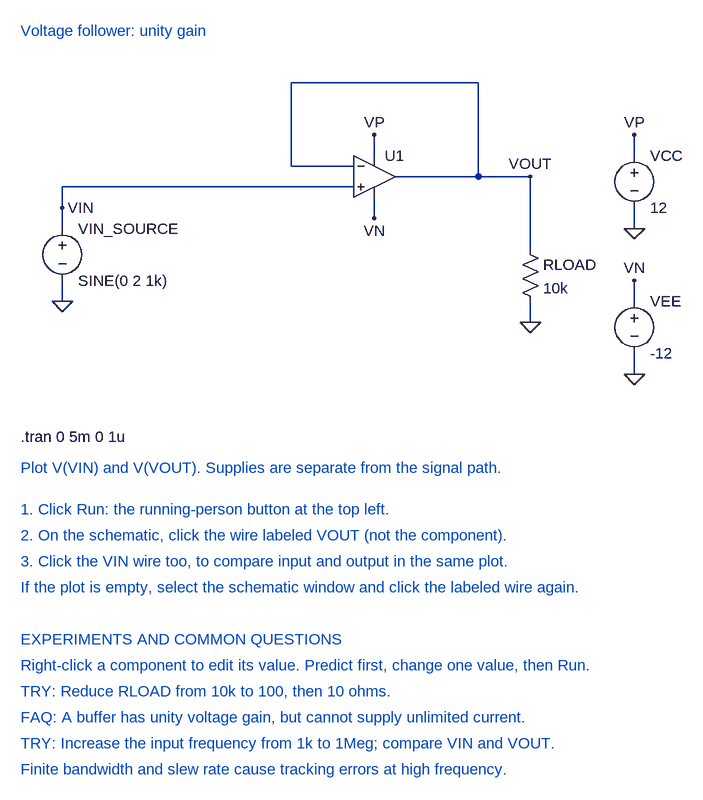
[diagram p0: schematic 06-voltage-follower.asc]
06-voltage-follower.asc, the LTspice schematic file:
Version 4
SHEET 1 1200 1400
WIRE 608 224 608 192
WIRE 608 288 608 320
WIRE 128 304 128 336
WIRE 128 416 128 448
WIRE 128 304 128 272
WIRE 128 272 576 272
WIRE 640 256 848 256
WIRE 848 256 848 368
WIRE 848 448 848 480
WIRE 480 240 576 240
WIRE 480 240 480 112
WIRE 480 112 768 112
WIRE 768 112 768 256
WIRE 1008 192 1008 224
WIRE 1008 304 1008 336
WIRE 1008 416 1008 448
WIRE 1008 528 1008 560
FLAG 608 192 VP
FLAG 608 320 VN
FLAG 128 304 VIN
FLAG 128 448 0
FLAG 848 256 VOUT
FLAG 848 480 0
FLAG 1008 192 VP
FLAG 1008 336 0
FLAG 1008 416 VN
FLAG 1008 560 0
SYMBOL Opamps\UniversalOpamp2 608 256 R0
SYMATTR InstName U1
SYMBOL voltage 128 320 R0
SYMATTR InstName VIN_SOURCE
SYMATTR Value SINE(0 2 1k)
SYMBOL res 832 352 R0
SYMATTR InstName RLOAD
SYMATTR Value 10k
SYMBOL voltage 1008 208 R0
SYMATTR InstName VCC
SYMATTR Value 12
SYMBOL voltage 1008 432 R0
SYMATTR InstName VEE
SYMATTR Value -12
TEXT 64 32 Left 2 ;Voltage follower: unity gain
TEXT 64 656 Left 2 !.tran 0 5m 0 1u
TEXT 64 704 Left 2 ;Plot V(VIN) and V(VOUT). Supplies are separate from the signal path.
TEXT 64 768 Left 2 ;1. Click Run: the running-person button at the top left.
TEXT 64 808 Left 2 ;2. On the schematic, click the wire labeled VOUT (not the component).
TEXT 64 848 Left 2 ;3. Click the VIN wire too, to compare input and output in the same plot.
TEXT 64 888 Left 2 ;If the plot is empty, select the schematic window and click the labeled wire again.
TEXT 64 968 Left 2 ;EXPERIMENTS AND COMMON QUESTIONS
TEXT 64 1008 Left 2 ;Right-click a component to edit its value. Predict first, change one value, then Run.
TEXT 64 1048 Left 2 ;TRY: Reduce RLOAD from 10k to 100, then 10 ohms.
TEXT 64 1088 Left 2 ;FAQ: A buffer has unity voltage gain, but cannot supply unlimited current.
TEXT 64 1128 Left 2 ;TRY: Increase the input frequency from 1k to 1Meg; compare VIN and VOUT.
TEXT 64 1168 Left 2 ;Finite bandwidth and slew rate cause tracking errors at high frequency.

The netlist it stands for:
* 06-voltage-follower.asc
XU1 VIN VOUT VP VN VOUT level.2 Avol=1Meg GBW=10Meg Slew=10Meg ilimit=25m rail=0 Vos=0 phimargin=45 en=0 enk=0 in=0 ink=0 Rin=500Meg  ; pins IN+ IN- V+ V- OUT
VIN_SOURCE VIN 0 SINE(0 2 1k)
RLOAD VOUT 0 10k
VCC VP 0 12
VEE VN 0 -12
* Voltage follower: unity gain
.tran 0 5m 0 1u
* Plot V(VIN) and V(VOUT). Supplies are separate from the signal path.
* 1. Click Run: the running-person button at the top left.
* 2. On the schematic, click the wire labeled VOUT (not the component).
* 3. Click the VIN wire too, to compare input and output in the same plot.
* If the plot is empty, select the schematic window and click the labeled wire again.
* EXPERIMENTS AND COMMON QUESTIONS
* Right-click a component to edit its value. Predict first, change one value, then Run.
* TRY: Reduce RLOAD from 10k to 100, then 10 ohms.
* FAQ: A buffer has unity voltage gain, but cannot supply unlimited current.
* TRY: Increase the input frequency from 1k to 1Meg; compare VIN and VOUT.
* Finite bandwidth and slew rate cause tracking errors at high frequency.
.lib UniversalOpamps2.sub
.backanno
.end